# Altium schematic sheet BLE-Section.SchDoc
size A4; SheetNumber: 6; SheetTotal: 8
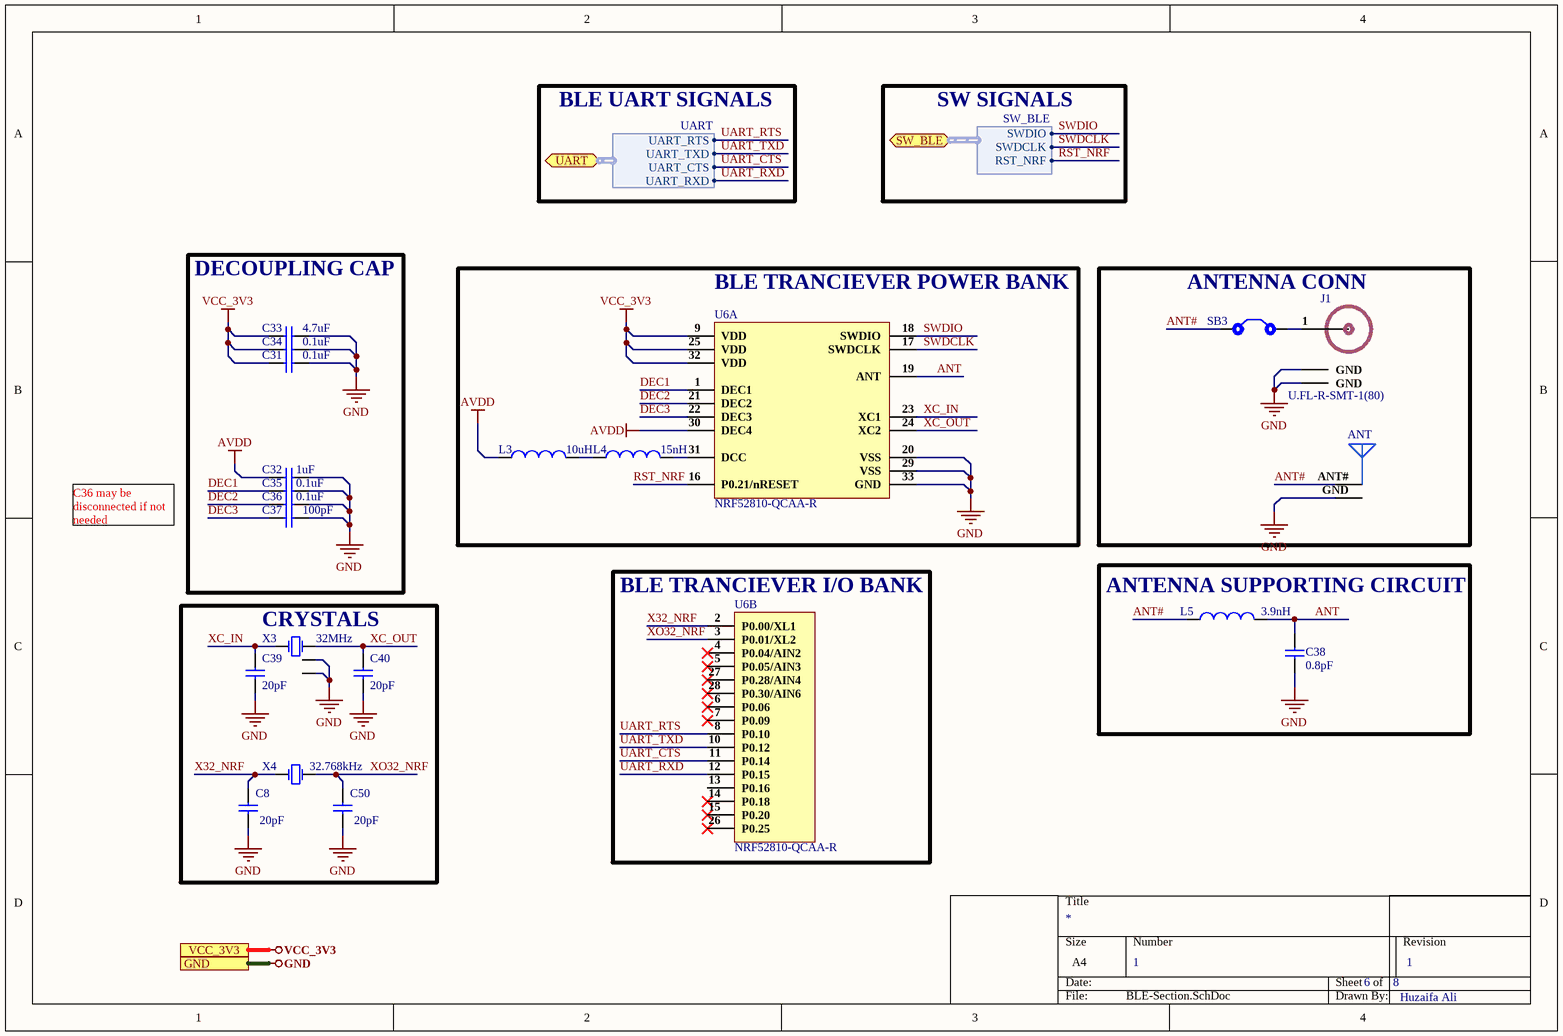
[diagram p0: BLE-Section.SchDoc]

## Parts
ANT  Antenna  [ANT#]  (value not drawn)  (net tie)
C8  20pF  [Cap 0402]
C31  0.1uF  [Cap 0402]
C32  1uF  [Cap 0402]
C33  4.7uF  [Cap 0402]
C34  0.1uF  [Cap 0402]
C35  0.1uF  [Cap 0402]
C36  0.1uF  [Cap 0402]
C37  100pF  [Cap 0402]
C38  0.8pF  [Cap 0402]
C39  20pF  [Cap 0402]
C40  20pF  [Cap 0402]
C50  20pF  [Cap 0402]
J1  U.FL-R-SMT-1(80)  [U.FL-R-SMT-1(80)]
L3  10uH  [Ind0805]
L4  15nH  [SCW1608C15NJST]
L5  3.9nH  [IND 0603]
SB3  Solder Bridge  [Solder Bridge]  (value not drawn)
U6  NRF52810-QCAA-R  [32 QFN]  (parts A,B of 2)
X3  32MHz  [XC32M4-32.000-F12NLDT]
X4  32.768kHz  [X321532768KGD2SI]

## Blocks framed on the sheet
DECOUPLING CAP: C31-C37
BLE TRANCIEVER POWER BANK: L3 L4 U6
ANTENNA CONN: ANT J1 SB3
ANTENNA SUPPORTING CIRCUIT: C38 L5
CRYSTALS: C8 C39 C40 C50 X3 X4
BLE TRANCIEVER I/O BANK: U6

## Ports
GND, SW_BLE (bidir, harness SW_BLE), UART (bidir, harness UART), VCC_3V3

## Harnesses
UART: UART_RTS, UART_TXD, UART_CTS, UART_RXD
SW_BLE: SWDIO, SWDCLK, RST_NRF

## Nets
AVDD: C32.1 L3.2 U6.30(DEC4)
GND: ANT.GND C8.1 C31.2 C32.2 C33.2 C34.2 C35.1 C36.1 C37.2 C38.1 C39.1 C40.1 C50.1 J1.2(GND) J1.3(GND) U6.20(VSS) U6.29(VSS) U6.33(GND) X3.2(GND) X3.4(GND) ; port GND
VCC_3V3: C31.1 C33.1 C34.1 U6.9(VDD) U6.25(VDD) U6.32(VDD) ; port VCC_3V3
ANT: C38.2 L5.2 U6.19(ANT)
ANT#: ANT.ANT# L5.1 SB3.1
DEC1: C35.2 U6.1(DEC1)
DEC2: C36.2 U6.21(DEC2)
DEC3: C37.1 U6.22(DEC3)
RST_NRF: U6.16(P0.21/nRESET) ; port SW_BLE.RST_NRF
SWDCLK: U6.17(SWDCLK) ; port SW_BLE.SWDCLK
SWDIO: U6.18(SWDIO) ; port SW_BLE.SWDIO
UART_CTS: U6.11(P0.14) ; port UART.UART_CTS
UART_RTS: U6.8(P0.10) ; port UART.UART_RTS
UART_RXD: U6.12(P0.15) ; port UART.UART_RXD
UART_TXD: U6.10(P0.12) ; port UART.UART_TXD
X32_NRF: C8.2 U6.2(P0.00/XL1) X4.1(OSC1)
XC_IN: C39.2 U6.23(XC1) X3.1(OSC1)
XC_OUT: C40.2 U6.24(XC2) X3.3(OSC2)
XO32_NRF: C50.2 U6.3(P0.01/XL2) X4.2(OSC2)
NetJ1_1: J1.1(RF_IN) SB3.2
NetL3_1: L3.1 L4.2
NetL4_1: L4.1 U6.31(DCC)

Not connected (* = marked no-connect by the designer): U6 4(P0.04/AIN2)* 5(P0.05/AIN3)* 6(P0.06)* 7(P0.09)* 13(P0.16) 14(P0.18)* 15(P0.20)* 26(P0.25)* 27(P0.28/AIN4)* 28(P0.30/AIN6)*

## Notes on the sheet
- BLE UART SIGNALS
- SW SIGNALS
- C36 may be disconnected if not needed
- 1
- Huzaifa Ali

## Library data of the parts
C8 C39 C40 C50 = CC0402JRNPO9BN200: CAP CER 20PF 50V C0G/NPO 0402; Manufacturer: Yageo; Tolerance: 5%; Dielectric: C0G; Supplier 1: Digi-Key; Manufacturer Part Number: CC0402JRNPO9BN200; Stock 1: 453493; Pricing 1: 1=0.1, 10=0.036, 100=0.0162, 500=0.01156, 1000=0.00908, 2500=0.00825, 5000=0.00759 (USD); Mount: Surface Mount; Case/Package: 0402; Number of Pins: 2; Weight: 2.3E-05oz; Case Code (Metric): 1005; Case Code (Imperial): 0402; Min Operating Temperature: -55°C; Max Operating Temperature: 125°C; Capacitance: 20pF; Voltage Rating: 50V; Packaging: Tape and Reel; Package Quantity: 1; Voltage Rating (DC): 50V; Termination: SMD/SMT; Composition: Ceramic; Length: 1mm; Width: 0.02inch; Thickness: 0.022inch; Depth: 0.5mm; REACH SVHC: No SVHC; Lead Free: Lead Free; ComponentLink1URL: http://www.yageo.com/documents/recent/UPY-GP_NP0_16V-to-50V_16.pdf?src-supplier=Digi-Key; ComponentLink1Description: http://www.yageo.com/documents/recent/UPY-GP_NP0_16V-to-50V_16.pdf?src-supplier=Digi-Key; ComponentLink2URL: http://www.yageo.com/documents/recent/UPY-GP_NP0_16V-to-50V_16.pdf?src-supplier=Mouser; ComponentLink2Description: http://www.yageo.com/documents/recent/UPY-GP_NP0_16V-to-50V_16.pdf?src-supplier=Mouser; Supplier Part Number 1: 311-1417-1-ND
C31 C34-C36 = GRM155R71H104ME14D: CAP CER 0.1UF 50V X7R 0402; Manufacturer: Murata; Tolerance: 20%; Capacitance: 100nF; Supplier 1: Digi-Key; Manufacturer Part Number: GRM155R71H104ME14D; Stock 1: 439844; Pricing 1: 1=0.1, 10=0.038, 100=0.0168, 500=0.01198, 1000=0.00941, 2500=0.00855, 5000=0.00787 (USD); Mount: Surface Mount; Case/Package: 0402; Min Operating Temperature: -55°C; Max Operating Temperature: 125°C; Packaging: Cut Tape; Voltage Rating: 50V; Length: 0.039inch; Width: 0.02inch; Thickness: 0.022inch; ComponentLink1URL: http://search.murata.co.jp/Ceramy/image/img/A01X/G101/ENG/GRM155R71H104ME14-01.pdf?src-supplier=Digi-Key; ComponentLink1Description: http://search.murata.co.jp/Ceramy/image/img/A01X/G101/ENG/GRM155R71H104ME14-01.pdf?src-supplier=Digi-Key; ComponentLink2URL: http://psearch.en.murata.com/capacitor/product/GRM155R71H104ME14%23.pdf?src-supplier=Avnet; ComponentLink2Description: http://psearch.en.murata.com/capacitor/product/GRM155R71H104ME14%23.pdf?src-supplier=Avnet; ComponentLink3URL: http://components.arrow.com/part/dataview/0323_07177683?src-supplier=Arrow+Europe; ComponentLink3Description: http://components.arrow.com/part/dataview/0323_07177683?src-supplier=Arrow+Europe; ComponentLink4URL: http://www.mouser.com/ds/2/281/c02e-2905.pdf?src-supplier=Mouser; ComponentLink4Description: http://www.mouser.com/ds/2/281/c02e-2905.pdf?src-supplier=Mouser; Supplier Part Number 1: 490-10701-1-ND
C32 = CC0402KRX5R7BB105: CAP CER 1UF 16V X5R 0402; Manufacturer: Yageo; Tolerance: 10%; Supplier 1: Digi-Key; Manufacturer Part Number: CC0402KRX5R7BB105; Stock 1: 1405667; Pricing 1: 1=0.36, 10=0.252, 100=0.1512, 500=0.1134, 1000=0.09576, 2500=0.09072, 5000=0.08568 (USD); Mount: Surface Mount; Case/Package: 0402; Weight: 2.3E-05oz; Case Code (Imperial): 0402; Case Code (Metric): 1005; Min Operating Temperature: -55°C; Max Operating Temperature: 85°C; Capacitance: 1uF; Dielectric: X5R; Packaging: Tape and Reel; Voltage Rating (DC): 16V; Voltage Rating: 16V; Termination: SMD/SMT; Composition: Ceramic; Length: 1mm; Height: 0.5mm; Width: 0.02inch; Thickness: 0.022inch; Depth: 0.5mm; Radiation Hardening: No; Lead Free: Lead Free; Halogen Free: Halogen Free; ComponentLink1URL: http://www.yageo.com/documents/recent/UPY-GPHC_X5R_4V-to-50V_12.pdf?src-supplier=Avnet+Europe; ComponentLink1Description: http://www.yageo.com/documents/recent/UPY-GPHC_X5R_4V-to-50V_12.pdf?src-supplier=Avnet+Europe; Supplier Part Number 1: 311-1691-6-ND
C33 = EDK105BBJ475MVLF: 16V 4.7uF ±20% 0402 Multilayer Ceramic Capacitors MLCC; Manufacturer: Taiyo Yuden; Manufacturer Part Number: EDK105BBJ475MVLF; Footprint: 0402; Value: 4.7uF
C37 = GCM1555C1H101JA16D: 0402 100 pF 50 V ±5 % Tolerance C0G SMT Multilayer Ceramic Capacitor; Manufacturer: Murata; Tolerance: 5%; Voltage Rating: 50V; Supplier 1: Arrow Electronics; Manufacturer Part Number: GCM1555C1H101JA16D; RoHS: Yes; Category: Ceramic Capacitors; Stock 1: 4560000; Pricing 1: 10000=0.00290 (USD); Mount: Surface Mount; Case/Package: 0402; Case Code (Metric): 1005; Case Code (Imperial): 0402; Weight: 0.000212oz; Min Operating Temperature: -55°C; Max Operating Temperature: 125°C; Capacitance: 100pF; Packaging: Tape and Reel; Dielectric: C0G; Voltage: 50V; Termination: SMD/SMT; Voltage Rating (DC): 50V; Package Quantity: 10000; Length: 1mm; Width: 0.02inch; Height: 0.5mm; Thickness: 0.022inch; Depth: 0.5mm; Ratings: AEC-Q200; Radiation Hardening: No; REACH SVHC: No SVHC; Lead Free: Lead Free; RoHS Compliant: Yes; ComponentLink1URL: https://datasheet.ciiva.com/26889/getdatasheetpartid-748988-26889122.pdf?src-supplier=Verical; ComponentLink1Description: https://datasheet.ciiva.com/26889/getdatasheetpartid-748988-26889122.pdf?src-supplier=Verical; Supplier Part Number 1: GCM1555C1H101JA16D
C38 = GJM1555C1HR80WB01D: CAP CER 0.8PF 50V C0G/NP0 0402; Manufacturer: Murata; Dielectric: C0G; Supplier 1: Arrow Electronics; Manufacturer Part Number: GJM1555C1HR80WB01D; RoHS: Yes; Category: Ceramic Capacitors; Stock 1: 5080000; Pricing 1: 10000=0.04420, 20000=0.03850 (USD); Mount: Surface Mount; Case/Package: 0402; Case Code (Metric): 1005; Case Code (Imperial): 0402; Min Operating Temperature: -55°C; Max Operating Temperature: 125°C; Package Quantity: 10000; Capacitance: 0.8pF; Voltage Rating: 50V; Packaging: Tape and Reel; Voltage Rating (DC): 50V; Termination: SMD/SMT; Series: GJM; Construction: Flat; Length: 1mm; Width: 0.02inch; Height: 0.5mm; Thickness: 0.022inch; Depth: 0.5mm; Radiation Hardening: No; RoHS Compliant: Yes; ComponentLink1URL: https://datasheet.ciiva.com/170/product-170100.pdf?src-supplier=Digi-Key; ComponentLink1Description: https://datasheet.ciiva.com/170/product-170100.pdf?src-supplier=Digi-Key; ComponentLink2URL: https://datasheet.ciiva.com/11616/product-11616842.pdf?src-supplier=Avnet; ComponentLink2Description: https://datasheet.ciiva.com/11616/product-11616842.pdf?src-supplier=Avnet; Supplier Part Number 1: GJM1555C1HR80WB01D
J1 = U.FL-R-SMT-1(80): CONN U.FL RCPT STR 50 OHM SMD; Manufacturer: Hirose; Supplier 1: Future Electronics; Manufacturer Part Number: U.FL-R-SMT-1(80); Stock 1: 1272; Pricing 1: 1=1.07, 500=0.785, 1500=0.74, 2500=0.72, 5000=0.695 (USD); Case/Package: SMD/SMT; Package Quantity: 10000; Packaging: Tape and Reel; Lead Free: Lead Free; ComponentLink1URL: https://www.hirose.com/product/en/download_file/key_name/U.FL-R-SMT-1%2880%29/category/Specification%20Sheet/doc_file_id/37638/?file_category_id=9&item_id=03310472280&is_series=&src-supplier=Digi-Key; ComponentLink1Description: https://www.hirose.com/product/en/download_file/key_name/U.FL-R-SMT-1%2880%29/category/Specification%20Sheet/doc_file_id/37638/?file_category_id=9&item_id=03310472280&is_series=&src-supplier=Digi-Key; ComponentLink2URL: http://www.mouser.com/ds/2/185/U.FL_catalog-939761.pdf?src-supplier=Mouser; ComponentLink2Description: http://www.mouser.com/ds/2/185/U.FL_catalog-939761.pdf?src-supplier=Mouser; Supplier Part Number 1: U.FL-R-SMT-1(80)-CUTT
L3 = MGFL2012F100MT-LF: 500mA 10uH ±20% 320mΩ 0805 Inductors (SMD) ROHS; Manufacturer: microgate; Manufacturer Part Number: MGFL2012F100MT-LF; Footprint: IND 0805; Value: 10uH
L4 = SCW1608C15NJST: 550mA 15nH ±5% 150mΩ SMD,1.68x1x0.85mm Inductors (SMD) ROHS; Manufacturer: Sunltech; Manufacturer Part Number: SCW1608C15NJST; Footprint: Custom; ComponentLink1Description: LCSC; ComponentLink1URL: https://lcsc.com/product-detail/Inductors-SMD_Sunltech-Tech-SCW1608C15NJST_C231879.html
L5 = LQW18AN3N9C10D: Inductor RF Chip Wirewound 3.9nH 0.2nH 100MHz 38Q-Factor 1A 32mOhm DCR 0603 Paper T/R; Manufacturer: Murata; Core Material: Non-Magnetic; Shielding: Unshielded; Self Resonant Frequency: 11GHz; DC Resistance (DCR): 32mR; Q Factor: 38; Supplier 1: RSComponents; Manufacturer Part Number: LQW18AN3N9C10D; RoHS: Yes; Category: Fixed Inductors; Stock 1: 1; Pricing 1: 10=0.16800 (USD); Mount: Surface Mount; Case/Package: 0603; Weight: 0.000106oz; Case Code (Metric): 1608; Case Code (Imperial): 0603; Min Operating Temperature: -55°C; Max Operating Temperature: 125°C; Packaging: Tape and Reel; Inductance: 3.9nH; Package Quantity: 4000; Current Rating: 1A; Resistor Type: Wirewound; Test Frequency: 100MHz; Max DC Current: 1A; Termination: SMD/SMT; DC Current: 1A; Series: LQW18A_10; Length: 1.6mm; Width: 0.031inch; Height: 0.8mm; Height - Seated (Max): 0.039inch; Depth: 1.1mm; Radiation Hardening: No; REACH SVHC: No SVHC; Military Standard: Not; RoHS Compliant: Yes; ComponentLink1URL: https://datasheet.ciiva.com/11799/0900766b80a002db-11799288.pdf?src-supplier=RSComponents; ComponentLink1Description: https://datasheet.ciiva.com/11799/0900766b80a002db-11799288.pdf?src-supplier=RSComponents; ComponentLink2URL: https://datasheet.ciiva.com/6705/l0075s0080lqw18a-10-6705579.pdf?src-supplier=Digi-Key; ComponentLink2Description: https://datasheet.ciiva.com/6705/l0075s0080lqw18a-10-6705579.pdf?src-supplier=Digi-Key; ComponentLink3URL: https://datasheet.ciiva.com/6705/l0075s0080lqw18a-10-6705577.pdf?src-supplier=Digi-Key; ComponentLink3Description: https://datasheet.ciiva.com/6705/l0075s0080lqw18a-10-6705577.pdf?src-supplier=Digi-Key; ComponentLink4URL: https://datasheet.ciiva.com/6705/l0075s0080lqw18a-10-6705578.pdf?src-supplier=Digi-Key; ComponentLink4Description: https://datasheet.ciiva.com/6705/l0075s0080lqw18a-10-6705578.pdf?src-supplier=Digi-Key; ComponentLink5URL: https://datasheet.ciiva.com/4976/product-4976636.pdf?src-supplier=Mouser; ComponentLink5Description: https://datasheet.ciiva.com/4976/product-4976636.pdf?src-supplier=Mouser; Supplier Part Number 1: 7242951
SB3 = Solder Bridge: Solder Bridge ON
U6 = NRF52810-QCAA-R: IC RF TXRX+MCU BLUETOOTH 32WFQFN; Manufacturer: Nordic Semiconductor; Supplier 1: Digi-Key; Manufacturer Part Number: NRF52810-QCAA-R; RoHS: Yes; Category: RF Receivers, Transceivers; Stock 1: 2906; Pricing 1: 1=3.54000, 10=3.16200, 25=2.84640, 100=2.59320, 250=2.34024, 500=2.09990, 1000=1.77100 (USD); RoHS Compliant: Yes; Supplier Part Number 1: 1490-NRF52810-QCAA-RCT-ND
X3 = XC32M4-32.000-F12NLDT: 32MHz SMD Crystal Resonator 12pF 40Ω ±10ppm ±20ppm -40℃~+85℃ SMD3225-4P Crystals ROHS; Manufacturer: HCI; Manufacturer Part Number: XC32M4-32.000-F12NLDT; Footprint: Custom
X4 = X321532768KGD2SI: 32.768kHz SMD Crystal Resonator 12.5pF ±20ppm -40℃~+85℃ SMD3215-2P Crystals ROHS; Manufacturer: Yangxing Tech; Manufacturer Part Number: X321532768KGD2SI; Footprint: Custom; ComponentLink1Description: LCSC; ComponentLink1URL: https://www.lcsc.com/product-detail/Crystals_Yangxing-Tech-X321532768KGD2SI_C620155.html